# Altium project Interface.PrjPcb
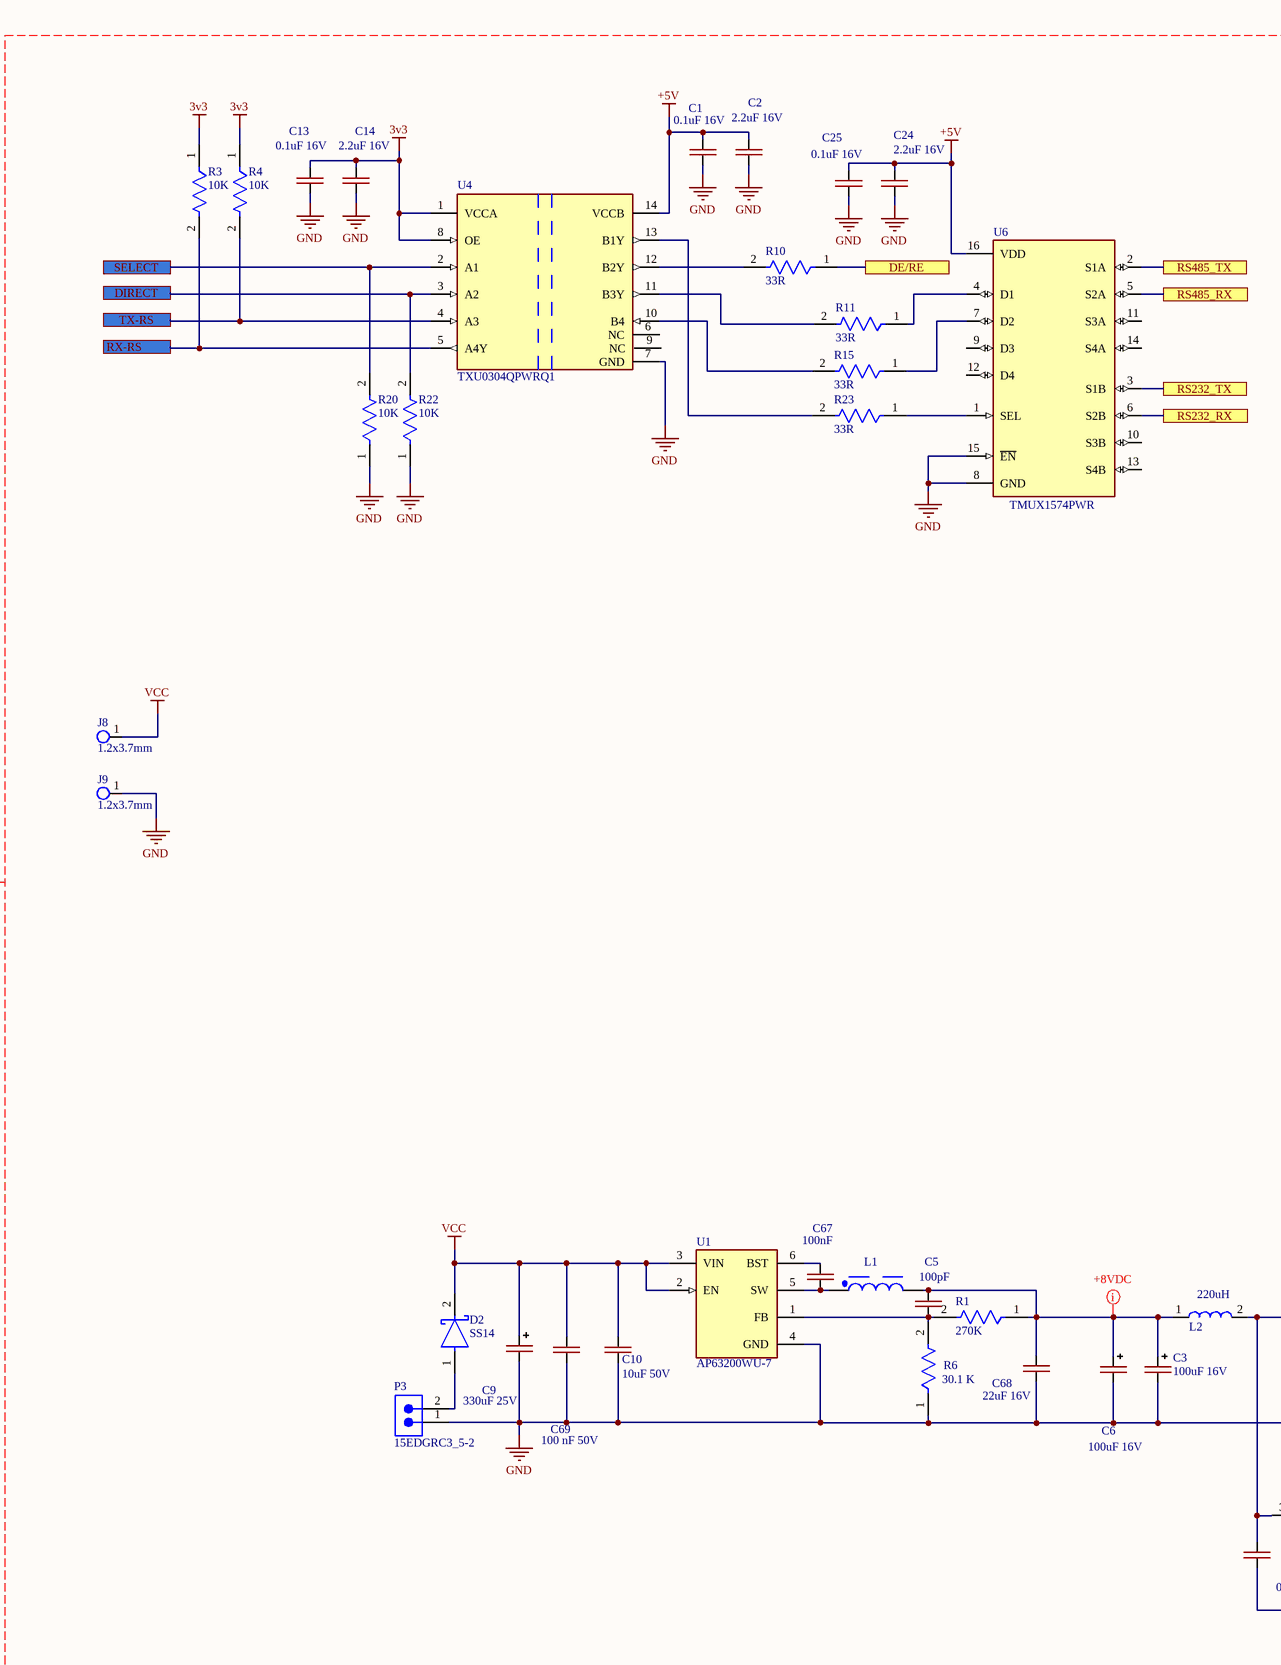
[diagram p0: Interface.SchDoc, left]
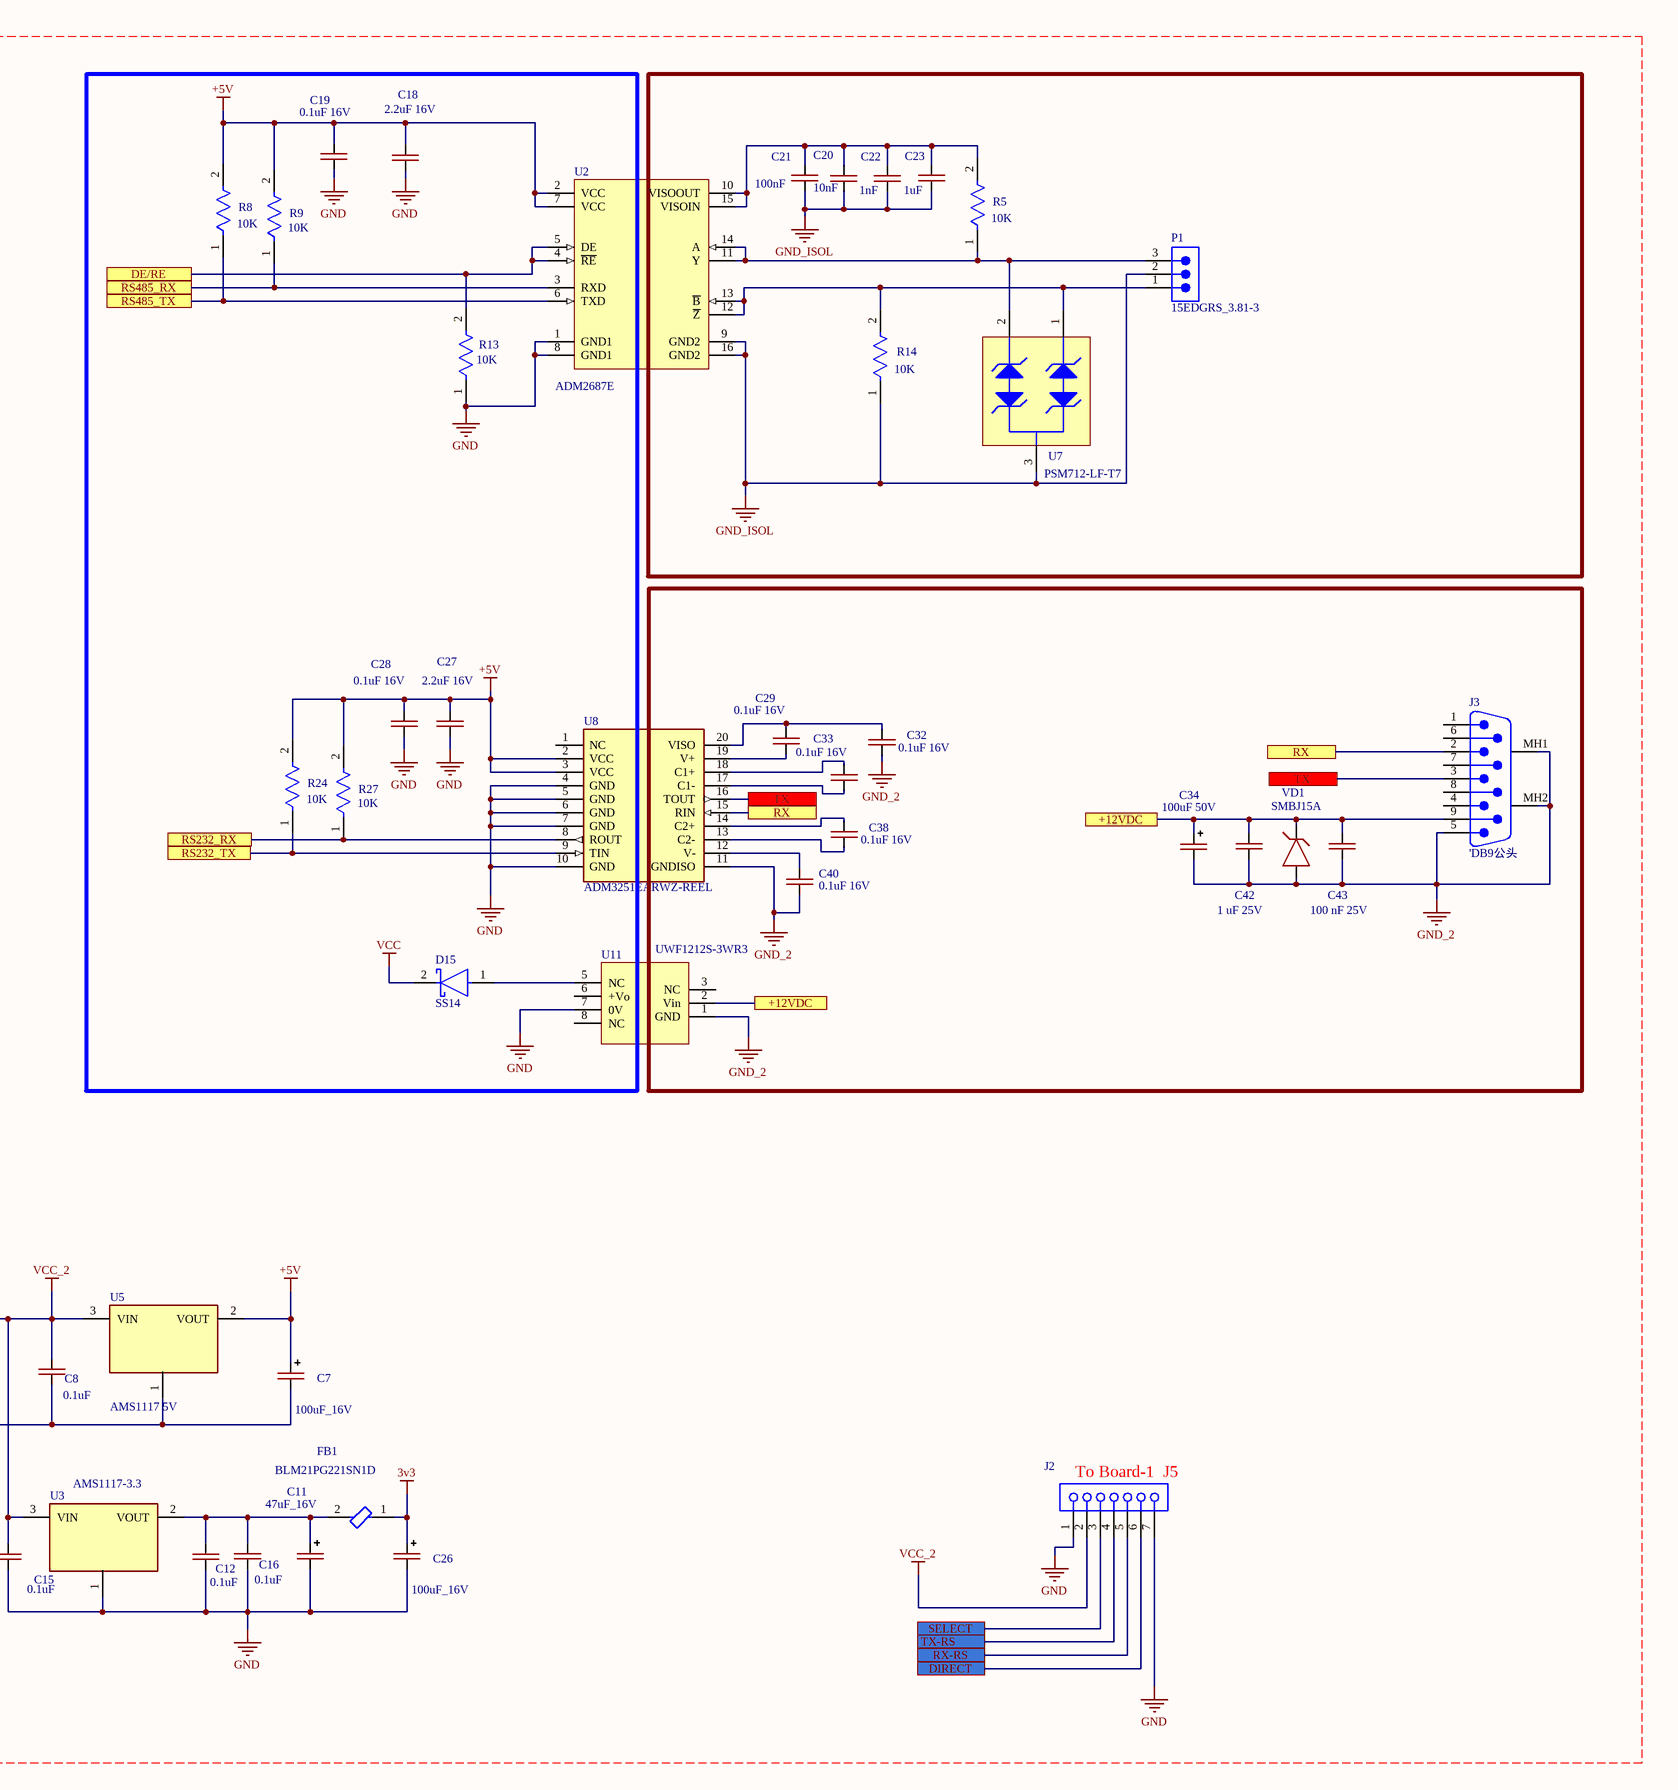
[diagram p1: Interface.SchDoc, right]
1 sheet, 75 parts. Net scope: flat (ports and power ports of the same name join across sheets).
Board file: Interface.PcbDoc

## Sheet Interface.SchDoc
size A1; SheetNumber: 1; SheetTotal: 1; SPICEModelCacheNLVBOJOE: <root> / <DocumentId>NLVBOJOE</DocumentId> / <CacheFrame Number="0"> / <Model Name="5848_744774112_12u" Kind="CKT"> / <Text>******* / .subckt 5848_744774112_12u 1 2 / Rp 1 2 22000 / Cp 1 2 3p / Rs 1 N3 0.065 / L1 N3 2 12u / .ends 5848_744774112_12u</Text> / </Model> / </CacheFrame> / </root>

### Parts
C1  0.1uF 16V  [CAP-0402]
C2  2.2uF 16V  [CAP-0402]
C3  100uF 16V  [CAP_A765EB_KEM-L]
C5  100pF  [CAP-0603]
C6  100uF 16V  [CAP_A765EB_KEM]
C7  100uF_16V  [CAP-TAN-C]
C8  0.1uF  [CAP-0603]
C9  330uF 25V  [CAP_SMD_Size_G]
C10  10uF 50V  [CAP-1206]
C11  47uF_16V  [CAP-TAN-C]
C12  0.1uF  [CAP-0603]
C13  0.1uF 16V  [CAP-0402]
C14  2.2uF 16V  [CAP-0402]
C15  0.1uF  [CAP-0603]
C16  0.1uF  [CAP-0603]
C18  2.2uF 16V  [CAP-0402]
C19  0.1uF 16V  [CAP-0402]
C20  10nF  [CAP-0402]
C21  100nF  [CAP-0402]
C22  1nF  [CAP-0402]
C23  1uF  [CAP-0603]
C24  2.2uF 16V  [CAP-0402]
C25  0.1uF 16V  [CAP-0402]
C26  100uF_16V  [CAP-TAN-C]
C27  2.2uF 16V  [CAP-0402]
C28  0.1uF 16V  [CAP-0402]
C29  0.1uF 16V  [CAP-0603]
C32  0.1uF 16V  [CAP-0603]
C33  0.1uF 16V  [CAP-0603]
C34  100uF 50V  [CAP_SMD_SIZE_D]
C38  0.1uF 16V  [CAP-0603]
C40  0.1uF 16V  [CAP-0603]
C42  1 uF 25V  [CAP-0805]
C43  100 nF 25V  [CAP-0805]
C67  100nF  [CAP-0603]
C68  22uF 16V  [CAP-1206]
C69  100 nF 50V  [CAP-0603]
D2  SS14  [DO-214-AC]
D15  SS14  [DO-214-AC]
FB1  BLM21PG221SN1D  [FP-BLM21-0_2-t0_85-e0_5-IPC_A]
J2  61300711821  [61300711821]  (value not drawn)
J3  'DB9公头  [DB9-1]
J8  1.2x3.7mm  [Pad_conn_1.2x3.7mm]
J9  1.2x3.7mm  [Pad_conn_1.2x3.7mm]
L1  12µH, 2A  [WE-PD2_5848]  (value not drawn)
L2  220uH  [Coil_4.5x4.5_mm]
P1  15EDGRS_3.81-3  [15EDGRC-3.81-3]
P3  15EDGRC3_5-2  [16EDGRC_3.81-2]
R1  270K  [RES-0402]
R3  10K  [RES-0402]
R4  10K  [RES-0402]
R5  10K  [RES-0402]
R6  30.1 K  [RES-0402]
R8  10K  [RES-0402]
R9  10K  [RES-0402]
R10  33R  [RES-0402]
R11  33R  [RES-0402]
R13  10K  [RES-0402]
R14  10K  [RES-0402]
R15  33R  [RES-0402]
R20  10K  [RES-0402]
R22  10K  [RES-0402]
R23  33R  [RES-0402]
R24  10K  [RES-0402]
R27  10K  [RES-0402]
U1  AP63200WU-7  [FP-TSOT26-MFG]
U2  ADM2687E  [RI_16_2_ADI-L]
U3  AMS1117-3.3  [SOT-89]
U4  TXU0304QPWRQ1  [FP-PW0014A-IPC_B]
U5  AMS1117 5V  [SOT-89]
U6  TMUX1574PWR  [TSSOP-16-A]
U7  PSM712-LF-T7  [PRKT-SOT23-3_V]
U8  ADM3251EARWZ-REEL  [FP-RW-20-IPC_B]
U11  UWF1212S-3WR3  [UWF_S-3WR3]
VD1  SMBJ15A  [DO-214AA]

### Ports
+12VDC, DE/RE, DIRECT, RS232_RX, RS232_TX, RS485_RX, RS485_TX, RX, RX-RS, SELECT, TX, TX-RS

### Nets
3v3: C13.1 C14.1 C26.1(+) FB1.1 R3.1 R4.1 U4.1(VCCA) U4.8(OE)
+5V: C1.1 C2.1 C7.1(+) C18.1 C19.1 C24.1 C25.1 C27.1 C28.1 R8.2 R9.2 R24.2 R27.2 U2.2(VCC) U2.7(VCC) U4.14(VCCB) U5.2(VOUT) U6.16(VDD) U8.2(VCC) U8.3(VCC)
GND: C1.2 C2.2 C3.2(-) C6.2(-) C7.2(-) C8.1 C9.2(-) C10.2 C11.2(-) C12.1 C13.2 C14.2 C15.1 C16.1 C18.2 C19.2 C24.2 C25.2 C26.2(-) C27.2 C28.2 C68.2 C69.2 J2.1 J2.7 J9.1 P3.1 R6.1 R13.1 R20.1 R22.1 U1.4(GND) U2.1(GND1) U2.8(GND1) U3.1(Ground) U4.7(GND) U5.1(Ground) U6.8(GND) U6.15(~{EN}) U8.4(GND) U8.5(GND) U8.6(GND) U8.7(GND) U8.10(GND) U11.7(0V)
GND_2: C32.1 C34.2(-) C40.1 C42.2 C43.2 J3.5 J3.MH1 J3.MH2 U8.11(GNDISO) U11.1(GND) VD1.2(A)
GND_ISOL: C20.2 C21.2 C22.2 C23.2 P1.2 R14.1 U2.9(GND2) U2.16(GND2) U7.3
VCC: C9.1(+) C10.1 C69.1 D2.2(C) D15.2(C) J8.1 U1.2(EN) U1.3(VIN)
VCC_2: C8.2 C15.2 J2.2 L2.2 U3.3(VIN) U5.3(VIN)
NetC3_1: C3.1(+) C5.1 C6.1(+) C68.1 L1.2 L2.1 R1.1
NetC5_2: C5.2 R1.2 R6.2 U1.1(FB)
NetC11_1: C11.1(+) C12.2 C16.2 FB1.2 U3.2(VOUT)
NetC20_1: C20.1 C21.1 C22.1 C23.1 R5.2 U2.10(VISOOUT) U2.15(VISOIN)
NetC29_1: C29.1 U8.19(V+)
NetC29_2: C29.2 C32.2 U8.20(VISO)
NetC33_1: C33.1 U8.17(C1-)
NetC33_2: C33.2 U8.18(C1+)
NetC34_1: C34.1(+) C42.1 C43.1 J3.9 U11.2(Vin) VD1.1(C) ; port +12VDC
NetC38_1: C38.1 U8.13(C2-)
NetC38_2: C38.2 U8.14(C2+)
NetC40_2: C40.2 U8.12(V-)
NetC67_1: C67.1 U1.6(BST)
NetC67_2: C67.2 L1.1 U1.5(SW)
NetD2_1: D2.1(A) P3.2
NetD15_1: D15.1(A) U11.5(NC)
NetJ2_3: J2.3 R20.2 U4.2(A1) ; port SELECT
NetJ2_4: J2.4 R4.2 U4.4(A3) ; port TX-RS
NetJ2_5: J2.5 R3.2 U4.5(A4Y) ; port RX-RS
NetJ2_6: J2.6 R22.2 U4.3(A2) ; port DIRECT
NetJ3_2: J3.2 U8.15(RIN) ; port RX
NetJ3_3: J3.3 U8.16(TOUT) ; port TX
NetP1_1: P1.1 R14.2 U2.12(~{Z}) U2.13(~{B}) U7.1
NetP1_3: P1.3 R5.1 U2.11(Y) U2.14(A) U7.2
NetR8_1: R8.1 U2.6(TXD) U6.2(S1A) ; port RS485_TX
NetR9_1: R9.1 U2.3(RXD) U6.5(S2A) ; port RS485_RX
NetR10_1: R10.1 R13.2 U2.4(~{RE}) U2.5(DE) ; port DE/RE
NetR10_2: R10.2 U4.12(B2Y)
NetR11_1: R11.1 U6.4(D1)
NetR11_2: R11.2 U4.11(B3Y)
NetR15_1: R15.1 U6.7(D2)
NetR15_2: R15.2 U4.10(B4)
NetR23_1: R23.1 U6.1(SEL)
NetR23_2: R23.2 U4.13(B1Y)
NetR24_1: R24.1 U6.3(S1B) U8.9(TIN) ; port RS232_TX
NetR27_1: R27.1 U6.6(S2B) U8.8(ROUT) ; port RS232_RX

Not connected (* = marked no-connect by the designer): J3 1 4 6 7 8; U4 6(NC) 9(NC); U6 9(D3) 10(S3B) 11(S3A) 12(D4) 13(S4B) 14(S4A); U8 1(NC); U11 3(NC) 6(+Vo) 8(NC)

### Layout directives
mark named +8VDC: NetC3_1
CompClassName: Interface: 3v3, +5V, GND, GND_2, GND_ISOL, VCC, VCC_2

### Notes on the sheet
- (near J2) To Board-1  J5

### Library data of the parts
C1 C13 C19 C25 C28 = CAP-NON-POLAR: 0.1uF 16V X7R / GRM155R71C104KA88D
C2 C14 C18 C24 C27 = CAP-NON-POLAR: 2.2uF 16V X5R GRM155R61C225KE11D
C3 C6 = CAP_POL_SMD: KEMET A765EB107M1CLAE025 / 100uF 16V 25mΩ 125mA@120Hz ±20% SMD,D6.3xL6mm Aluminum
C5 = CAP-NON-POLAR: 100pF 50V  C0G   Murata GRM1885C1H101JA01D
C7 C9 C26 = CAP_POL_SMD
C8 C12 C15 C16 C20-C23 C29 C32 C33 C38 C40 = CAP-NON-POLAR
C10 = CAP-NON-POLAR: 10uF 50V X7R  Yageo  CC1206KKX7R9BB106
C11 = CAP-POLAR
C34 = CAP_POL_SMD: 100uF 50V  JVJ50V100M6x8
C42 = CAP-NON-POLAR: 1 uF 25V X7R
C43 = CAP-NON-POLAR: 100 nF 25V X7R
C67 = CAP-NON-POLAR: 100nF  50V  X7R  Murata GRM188R71H104KA93D
C68 = CAP-NON-POLAR: 22uF 16V   X7R   Murata GRM31CZ71C226ME15L
C69 = CAP-NON-POLAR: 100 nF 50V  X7R  GCM188R71H104KA57J
FB1 = BLM21PG221SN1D: Chip Ferrite Bead, 0805, 220Ω @ 100MHz, 0.045Ω, 25%, 2A
J2 = 61300711821: WR-PHD Socket Header, THT, Vertical, pitch 2.54mm, 1 Row, 7P; Manufacturer: Wurth Elektronik; Contact Resistance: 20mΩ; Rated Current: 3A; Working Voltage: 250V; Withstanding Voltage: 500V; ComponentLink1Description: Website Link; ComponentLink1URL: https://www.we-online.com/redexpert/article/61300711821?ad; ComponentLink2Description: Datasheet Link; ComponentLink2URL: https://www.we-online.com/redexpert/spec/61300711821?ad; Manufacturer Part Number: 61300711821; Category: Board-to-Board Connectors; Match Code: WR-PHD; Mount: Through Hole; Operating Temperature Max: 125°C; Operating Temperature Min: -40°C; Packaging: Tray; Gender: Socket Header; Number of Pins: 7; Number of Rows: 1; Orientation: Vertical; Pitch: 2.54mm
J3 = DB9: D-DMR009PM-D002  Ckmtw / 9P/弯插/公
J8 J9 = Klema_15_A
L1 = 744774112: WE-PD2 SMT Power Inductor, size 5848, 12µH, 2A, 0.11Ω; Manufacturer: Wurth Elektronik; Case/Size Code: 5848; DC Resistance: 0.082Ω; Saturation Current: 1.94A; Self Resonant Frequency: 24MHz; Manufacturer Part Number: 744774112; Category: Unshielded Power Inductors; Match Code: WE-PD2; ComponentLink1Description: Website Link; ComponentLink1URL: https://www.we-online.com/redexpert/article/744774112?ad; ComponentLink2Description: Datasheet Link; ComponentLink2URL: https://www.we-online.com/redexpert/spec/744774112?ad; Mount: Surface Mount; Operating Temperature Max: 125°C; Operating Temperature Min: -40°C; Packaging: Tape and Reel; Length: 5.8mm; Width: 5.2mm; Height: 4.5mm; DC Resistance Max: 0.11Ω; Inductance: 12µH; Rated Current: 2A
L2 = Coil
R1 R3-R5 R8-R11 R13-R15 R20 R22-R24 R27 = RES-CONST
R6 = RES-CONST: 30,1 K, 1%
U1 = AP63200WU-7: AP63200WU-7  IC REG BUCK ADJUSTABLE 2A TSOT26
U3 U5 = AMS1117
U4 = TXU0304QPWRQ1: Translation - Voltage Levels Automotive four chan nel unidirectional
U7 = CMP-2000-07553-1: TVS Array - Asymmetrical Data Line Protector, 600 W, 7.5 V, -55 to 150 degC, 3-Pin SOT23, RoHS, Tape and Reel; Manufacturer: Protek Devices; Min Breakdown Voltage: 7.5V; Direction: Bidirectional; Capacitance: 75pF; Current: 20uA; Power Dissipation: 600W; Working Voltage: 7V; Voltage: 12V; Case\/Package: SOT-23; Clamping Voltage: 17V; Element Configuration: Dual; Mounting Technology: SurfaceMount; RoHSCompliant: True; Radiation Hardening: No; Depth: 1.4mm; Lead Free: LeadFree; Package Description: 3-Pin Small Outline Transistor, Body 2.92 x 1.3 mm, Pitch 0.94 mm; Max Operating Temperature: 150degC; Length: 3.04mm; Manufacturer URL: http://www.protekdevices.com/; Min Operating Temperature: -55degC; Leakage Current: 20uA; Datasheet URL: www.protekdevices.com/xyz/documents/datasheets/psm712.pdf; Packaging: TapeandReel; Datasheet Version: 10/2013; Package Reference: SOT23-3; Number of Pins: 3
U8 = ADM3251EARWZ-REEL: DGTL ISO 2.5KV 2CH RS232 20SOIC
U11 = UWF_S-3WR3
VD1 = ESD_Unidirect